# Altium schematic sheet Connectors.SchDoc
size A; SheetNumber: 1; SheetTotal: 2
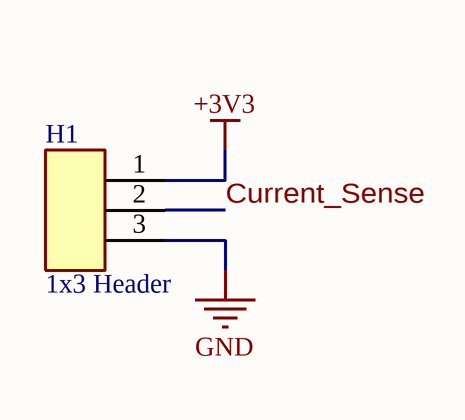
[diagram p0: Connectors.SchDoc]

## Parts
H1  1x3 Header  [[Header] 1x3 Male]

## Nets
+3V3: H1.1
GND: H1.3
Current_Sense: H1.2

## Library data of the parts
H1 = [Header] 1x3 Male: 2.54mm pitch